# Altium schematic sheet SR40A.SchDoc
size A4; SheetNumber: 6; SheetTotal: 9
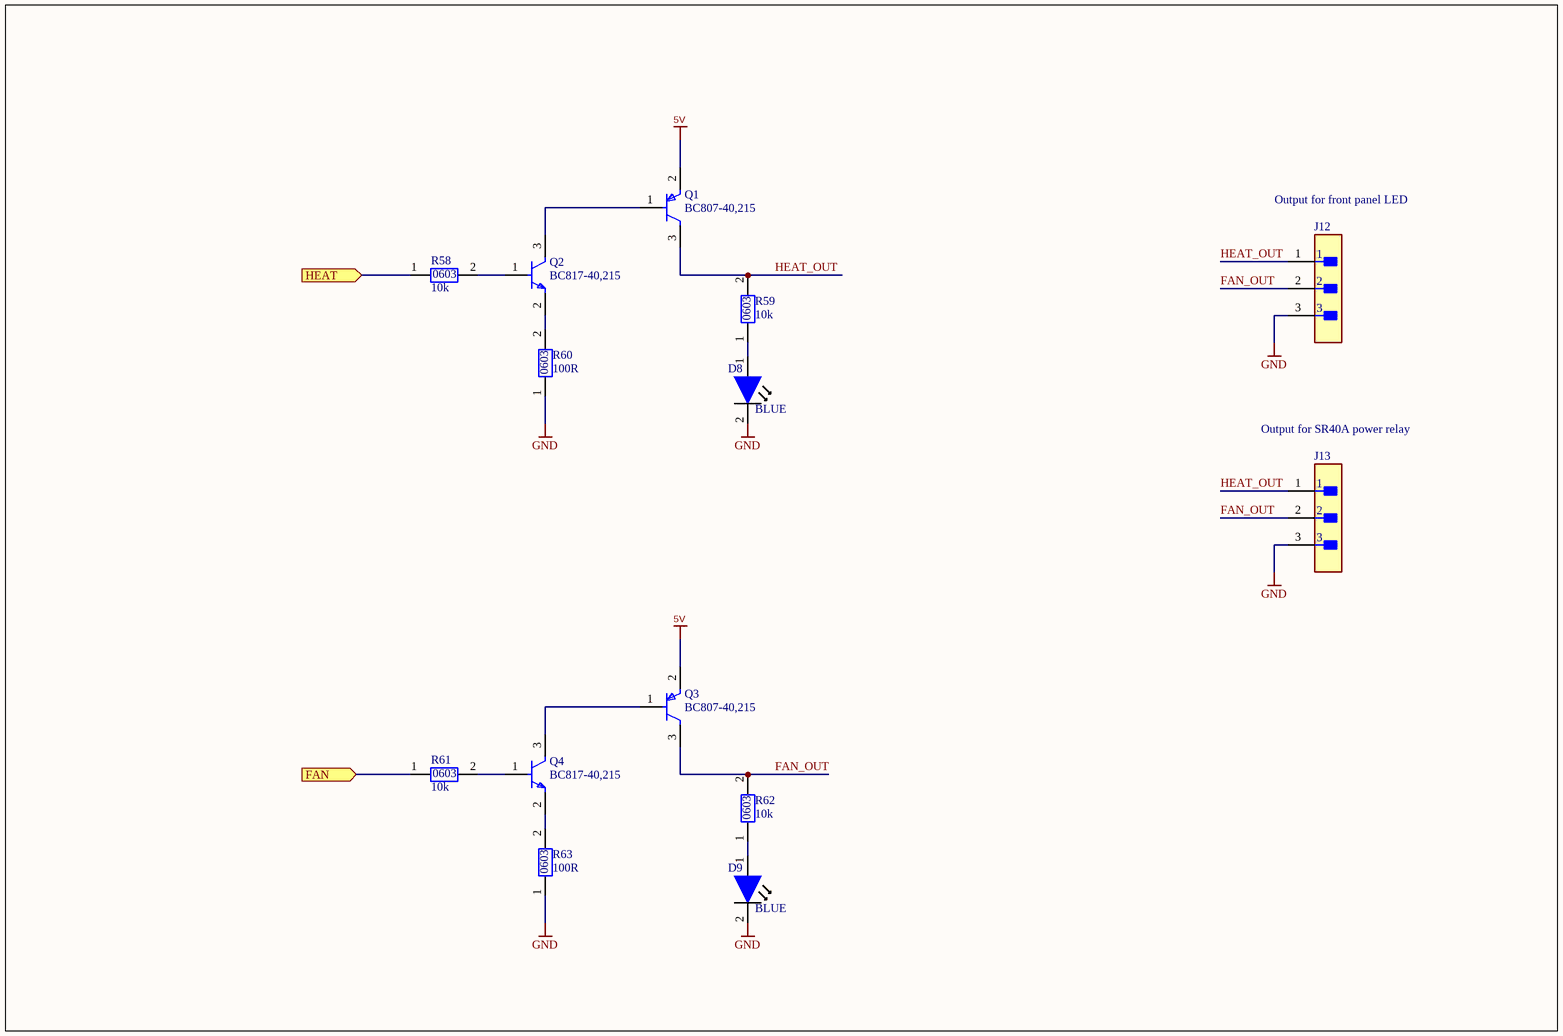
[diagram p0: SR40A.SchDoc]

## Parts
D8  SMD LED 0603  [0603 LED]  (value not drawn)
D9  SMD LED 0603  [0603 LED]  (value not drawn)
J12  B3B-XH-A(LF)(SN)  [FP-B3B-XH-A_LF_SN-MFG]  (value not drawn)
J13  B3B-XH-A(LF)(SN)  [FP-B3B-XH-A_LF_SN-MFG]  (value not drawn)
Q1  BC807-40,215  [FP-SOT23-IPC_B]
Q2  BC817-40,215  [FP-SOT23-MFG]
Q3  BC807-40,215  [FP-SOT23-IPC_B]
Q4  BC817-40,215  [FP-SOT23-MFG]
R58  SMD 0603 Resistor  [RESISTOR_SMD_0603]  (value not drawn)
R59  SMD 0603 Resistor  [RESISTOR_SMD_0603]  (value not drawn)
R60  SMD 0603 Resistor  [RESISTOR_SMD_0603]  (value not drawn)
R61  SMD 0603 Resistor  [RESISTOR_SMD_0603]  (value not drawn)
R62  SMD 0603 Resistor  [RESISTOR_SMD_0603]  (value not drawn)
R63  SMD 0603 Resistor  [RESISTOR_SMD_0603]  (value not drawn)

## Ports
FAN (in, see MAIN_SCHEMATIC[3C], STM32[2A]), HEAT (in, see MAIN_SCHEMATIC[3C], STM32[2A])

## Nets
5V: Q1.2(E) Q3.2(E)
GND: D8.2 D9.2 J12.3 J13.3 R60.1 R63.1
FAN: R61.1 ; port FAN
FAN_OUT: J12.2 J13.2 Q3.3(C) R62.2
HEAT: R58.1 ; port HEAT
HEAT_OUT: J12.1 J13.1 Q1.3(C) R59.2
NetD8_1: D8.1 R59.1
NetD9_1: D9.1 R62.1
NetQ1_1: Q1.1(B) Q2.3(C)
NetQ2_1: Q2.1(B) R58.2
NetQ2_2: Q2.2(E) R60.2
NetQ3_1: Q3.1(B) Q4.3(C)
NetQ4_1: Q4.1(B) R61.2
NetQ4_2: Q4.2(E) R63.2

## Notes on the sheet
- Output for front panel LED
- (near R58) 10k
- (near R60) 100R
- (near R59) 10k
- (near D8) BLUE
- Output for SR40A power relay
- (near R61) 10k
- (near R62) 10k
- (near R63) 100R
- (near D9) BLUE
- (in symbol SMD 0603 Resistor) 0603

## Library data of the parts
D8 D9 = SMD LED 0603: 0603 LED
J12 J13 = CMP-17439-000014-3: CONN HEADER VERT 3POS 2.5MM; Max Voltage Rating (DC): 250V; Number of Positions: 3; Current Rating: 3A; Gender: Male; Wire/Cable Gauge: 22AWG; Contact Resistance: 20mR; Insulation Resistance: 1GR; Insulation Material: Nylon; Contact Plating: Tin; Depth: 5.75mm; Contact Type: Male Pin; Max Operating Temperature: 85°C; Insulation Color: Natural; Voltage Rating (AC): 250V; Color: Natural; Connector Type: Header; Orientation: Straight; Fastening Type: Detent; Housing Color: White; Min Operating Temperature: -25°C; Termination: Solder; Voltage Rating: 250V; Series: XH; Pitch: 2.5mm; Contact Shape: Square; Number of Rows: 1; Lead Free: Lead Free; Packaging: Bulk; Mount: Through Hole; Flammability Rating: UL94 V-0; Max Voltage Rating (AC): 250V; REACH SVHC: No SVHC; Housing Material: Polyamide; Contact Material: Brass; Lead Pitch: 2.5mm; Contact Finish - Mating: TIN; Length: 9.9mm; Max Current Rating: 3A; Number of Contacts: 3
Q1 Q3 = CMP-14406-000042-1: TRANS PNP 45V 500MA TO236AB; RoHS Compliant: Yes
Q2 Q4 = CMP-14406-000007-1: TRANS NPN 45V 0.5A SOT23; Manufacturer: Nexperia; Collector Emitter Saturation Voltage: 700mV; Power Dissipation: 250mW; Collector Base Voltage: 50V; Unity Gain Freq: 100MHz; Hfe Max: 600; Rthja Max: 500K/W; Emitter Base Voltage: 5V; Max Collector Current: 500mA; Hfe Testvce: 1V; Automotive Grade: Grade 0; Hfe Min: 250; Max Junction Temp: +150°C; Number Of Npn: 1; Hfe Testic: 100mA; Octopart: https://octopart.com/bc817-40%2C215-nexperia-78739081; Lead Free: Yes; Ipc Land Pattern Name: SOT95P230X100-3; Manufacturer Part Number: BC817-40,215; RoHS: TRUE; Collector Emitter Breakdown Voltage: 45V; Digikey Description: TRANS NPN 45V 0.5A SOT23; ComponentLink2URL: https://assets.nexperia.com/documents/data-sheet/BC817_SER.pdf; Temperature Range High: +150°C; Mouser Description: BC817 Series 45 V 500 mA 250 mW SMT NPN General-Purpose Transistor - SOT-23-; Device Class L3: BJTs; Temperature: to +150°C; Height: 1.1mm; Automotive: Yes; Ambient Temperature Range Low: -65°C; Package: SOT23; Collector Emitter Voltage: 45V; Category: Trans; ComponentLink2Description: Datasheet; Device Class L2: Transistors; Ambient Temperature Range High: +150°C; Number Of Elements: 1; Device Class L1: Discrete Semiconductors; Footprint Url: https://assets.nexperia.com/documents/outline-drawing/SOT23.pdf
R58-R63 = SMD 0603 Resistor: 0603 resistor